# Altium schematic sheet 11_Digital_Input.SchDoc
size A4; SheetNumber: 12; SheetTotal: 12
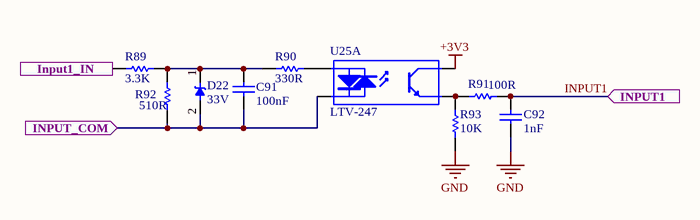
[diagram p0: 11_Digital_Input.SchDoc]

## Parts
C91  value 100nF  [CAP_0603]  (hidden comment: CL10B104KB8NNNL)
C92  value 1nF  [CAP_0603]  (hidden comment: CL10B102KB8NNNL)
D22  value 33V  [DO214AC_SMA___]  (hidden comment: P4SMAJ33A_R1_00001)
R89  value 3.3K  [RES_0603]  (hidden comment: 0603SAJ0332T5E)
R90  value 330R  [RES_0603]  (hidden comment: 0603SAF3300T5E)
R91  value 100R  [RES_0603]  (hidden comment: 0603SAF1000T5E)
R92  value 510R  [RES_0603]  (hidden comment: 0603SAF5100T5E)
R93  value 10K  [RES_0603]  (hidden comment: 0603SAF1002T5E)
U25  LTV-247  [16-SOIC(4.40mm Width)]  (part A of 4)

## Ports
INPUT1 (in), Input1_IN (in), INPUT_COM (in)

## Nets
+3V3: U25.16(C)
GND: C92.1 R93.1
INPUT1: C92.2 R91.2 ; port INPUT1
Input1_IN: R89.1 ; port Input1_IN
INPUT_COM: C91.1 D22.2 R92.1 U25.2(K) ; port INPUT_COM
NetC91_2: C91.2 D22.1 R89.2 R90.1 R92.2
NetR90_2: R90.2 U25.1(A)
NetR91_1: R91.1 R93.2 U25.15(E)

## Notes on the sheet
- Title
- Size:
- Date:
- A4
- Number:
- Rev.Number:
- Revision:
- Drawer/
- Sheet
- of
- YALIM
- Burak
- TURKEY
- File:

## Library data of the parts
C91 = CL10B104KB8NNNL: MLCC (1608) 0603 100nF 50VDC ±10% X7R; Manufacturer: Samsung Electro-Mechanics America, Inc; Supplier 1: OZDISAN; Manufacturer Part Number: CL10B104KB8NNNL
C92 = CL10B102KB8NNNL: MLCC (1608) 0603 1nF 50VDC ±10% X7R; Manufacturer: SAMSUNG; Supplier 1: OZDISAN; Manufacturer Part Number: CL10B102KB8NNNL
D22 = P4SMAJ33A_R1_00001: DIODE TVS 400W 33V DO-214AC SMA PANJIT; Supplier 1: OZDISAN; Manufacturer Part Number: P4SMAJ33A_R1_00001; Manufacturer: PANJIT
R89 = 0603SAJ0332T5E: RES.(1608) 0603 3.3K Ohms 5% 1/10W-S 100PPM; Manufacturer: ROYALOHM; Supplier 1: Ozdisan; Manufacturer Part Number: 0603SAJ0332T5E
R90 = 0603SAF3300T5E: RES.(1608) 0603 330 Ohms 1% 1/10W-S 100PPM; Manufacturer: ROYALOHM; Supplier 1: Ozdisan; Manufacturer Part Number: 0603SAF3300T5E
R91 = 0603SAF1000T5E: RES.(1608) 0603 100 Ohms 1% 1/10W-S 200PPM; Manufacturer: ROYALOHM; Supplier 1: Ozdisan; Manufacturer Part Number: 0603SAF1000T5E
R92 = 0603SAF5100T5E: RES.(1608) 0603 510 Ohms 1% 1/10W-S 100PPM; Manufacturer: ROYALOHM; Supplier 1: Ozdisan; Manufacturer Part Number: 0603SAF5100T5E
R93 = 0603SAF1002T5E: RES.(1608) 0603 10K Ohms 1% 1/10W-S 100PPM; Manufacturer: ROYALOHM; Supplier 1: Ozdisan; Manufacturer Part Number: 0603SAF1002T5E
U25 = LTV-247: Optoisolator Transistor Output 3750Vrms 4 Channel 16-SO; Manufacturer: Lite-On Inc.; Supplier 1: Digi-Key; Value: *; Manufacturer Part Number: LTV-247